# Altium schematic sheet TopLevel.SchDoc
size A
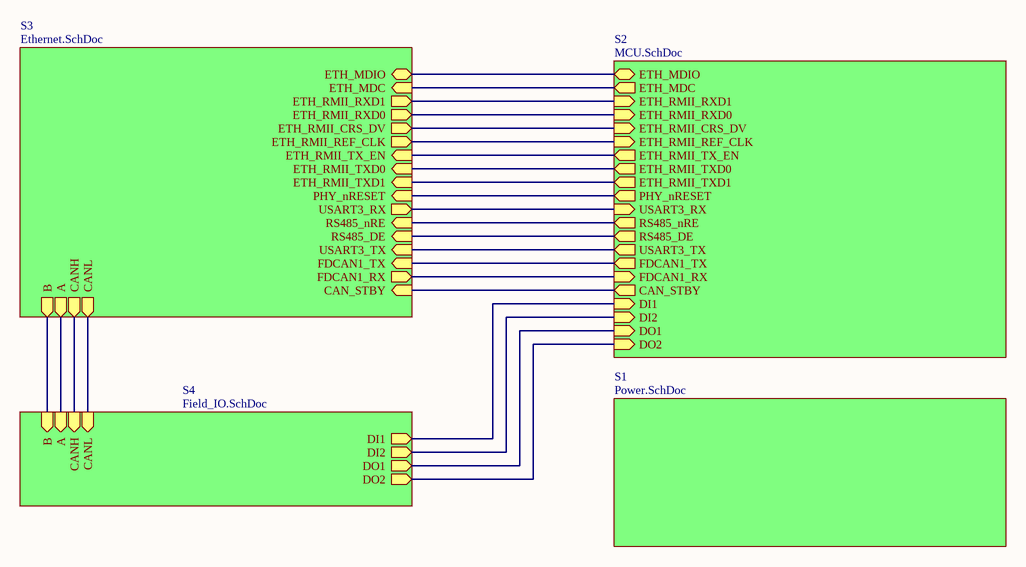
[diagram p0: TopLevel.SchDoc]

## Sub-sheets
S1 = Power.SchDoc: no entries
S2 = MCU.SchDoc: ETH_MDIO (bidir), ETH_MDC (out), ETH_RMII_RXD1 (in), ETH_RMII_RXD0 (in), ETH_RMII_CRS_DV (in), ETH_RMII_REF_CLK (in), ETH_RMII_TX_EN (out), ETH_RMII_TXD0 (out), ETH_RMII_TXD1 (out), PHY_nRESET (out), USART3_RX (in), RS485_nRE (out), RS485_DE (out), USART3_TX (out), FDCAN1_TX (out), FDCAN1_RX (in), CAN_STBY (out), DI1 (in), DI2 (in), DO1 (in), DO2 (in)
S3 = Ethernet.SchDoc: ETH_MDIO (bidir), ETH_MDC (in), ETH_RMII_RXD1 (out), ETH_RMII_RXD0 (out), ETH_RMII_CRS_DV (out), ETH_RMII_REF_CLK (out), ETH_RMII_TX_EN (in), ETH_RMII_TXD0 (in), ETH_RMII_TXD1 (in), PHY_nRESET (in), USART3_RX (out), RS485_nRE (in), RS485_DE (in), USART3_TX (in), FDCAN1_TX (in), FDCAN1_RX (out), CAN_STBY (in), B (out), A (out), CANH (out), CANL (out)
S4 = Field_IO.SchDoc: DI1 (out), DI2 (out), DO1 (out), DO2 (out), B (in), A (in), CANH (in), CANL (in)

## Nets
(unnamed): sheet S2/ETH_MDIO, sheet S3/ETH_MDIO
(unnamed): sheet S2/ETH_MDC, sheet S3/ETH_MDC
(unnamed): sheet S2/ETH_RMII_RXD1, sheet S3/ETH_RMII_RXD1
(unnamed): sheet S2/ETH_RMII_RXD0, sheet S3/ETH_RMII_RXD0
(unnamed): sheet S2/ETH_RMII_CRS_DV, sheet S3/ETH_RMII_CRS_DV
(unnamed): sheet S2/ETH_RMII_REF_CLK, sheet S3/ETH_RMII_REF_CLK
(unnamed): sheet S2/ETH_RMII_TX_EN, sheet S3/ETH_RMII_TX_EN
(unnamed): sheet S2/ETH_RMII_TXD0, sheet S3/ETH_RMII_TXD0
(unnamed): sheet S2/ETH_RMII_TXD1, sheet S3/ETH_RMII_TXD1
(unnamed): sheet S2/PHY_nRESET, sheet S3/PHY_nRESET
(unnamed): sheet S2/USART3_RX, sheet S3/USART3_RX
(unnamed): sheet S2/RS485_nRE, sheet S3/RS485_nRE
(unnamed): sheet S2/RS485_DE, sheet S3/RS485_DE
(unnamed): sheet S2/USART3_TX, sheet S3/USART3_TX
(unnamed): sheet S2/FDCAN1_TX, sheet S3/FDCAN1_TX
(unnamed): sheet S2/FDCAN1_RX, sheet S3/FDCAN1_RX
(unnamed): sheet S2/CAN_STBY, sheet S3/CAN_STBY
(unnamed): sheet S2/DI1, sheet S4/DI1
(unnamed): sheet S2/DI2, sheet S4/DI2
(unnamed): sheet S2/DO1, sheet S4/DO1
(unnamed): sheet S2/DO2, sheet S4/DO2
(unnamed): sheet S4/B, sheet S3/B
(unnamed): sheet S4/A, sheet S3/A
(unnamed): sheet S4/CANH, sheet S3/CANH
(unnamed): sheet S4/CANL, sheet S3/CANL